# Altium schematic sheet LCD_RGB_parallel_connector.SchDoc
size A3; SheetNumber: 1; SheetTotal: 3
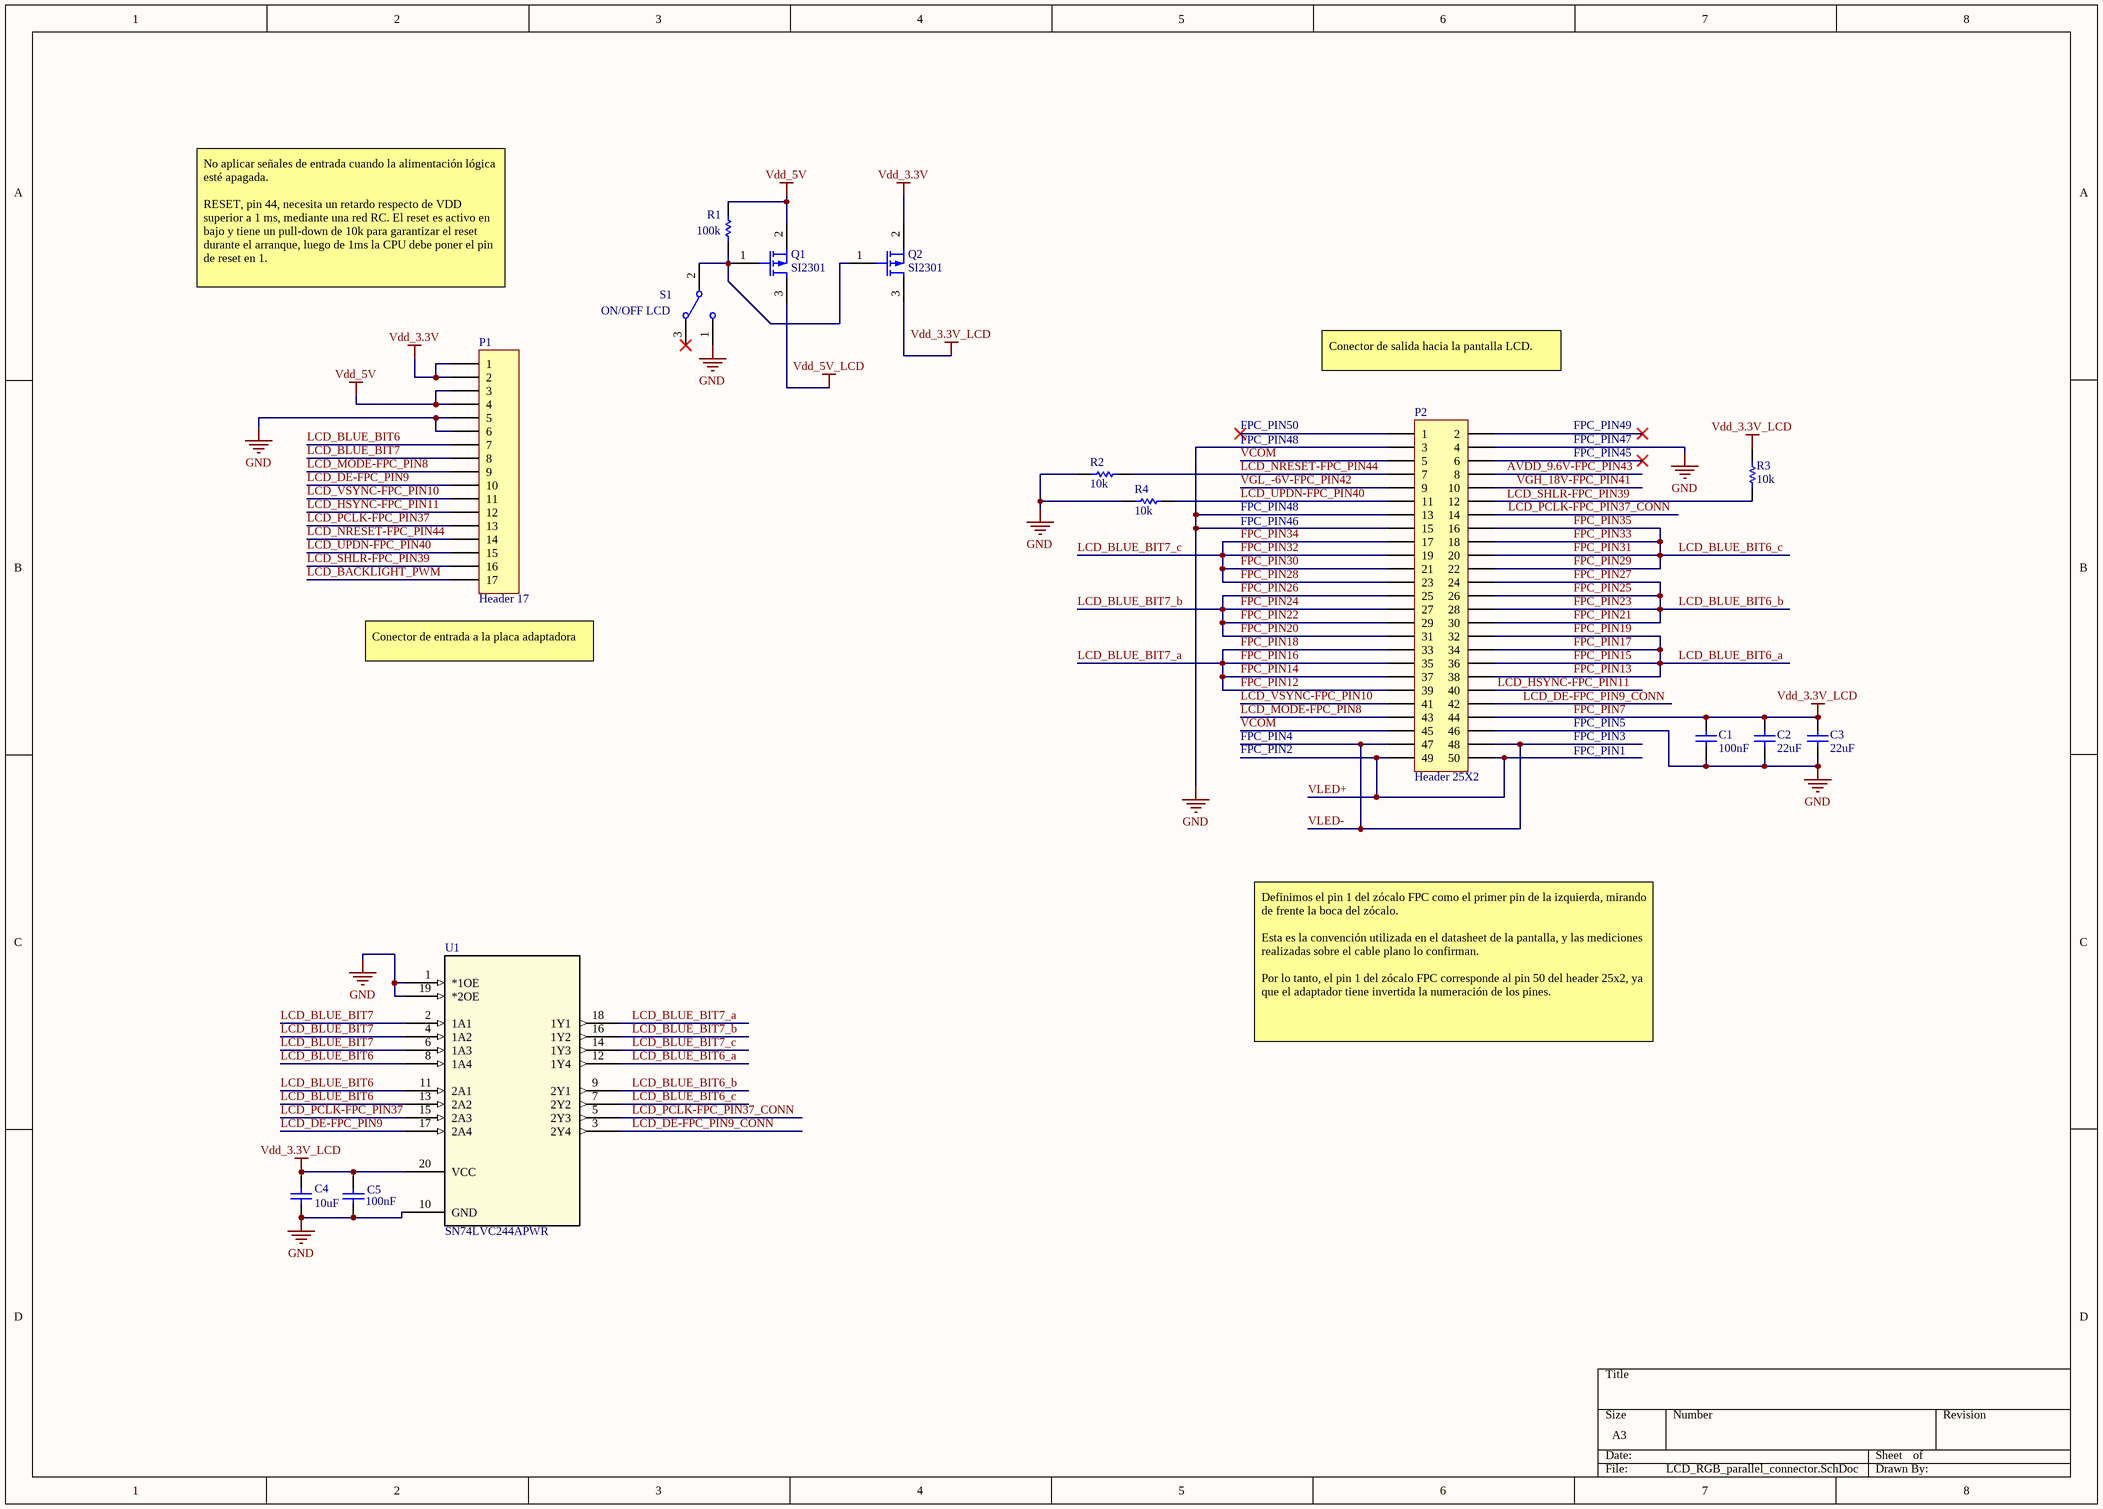
[diagram p0: LCD_RGB_parallel_connector.SchDoc]

## Parts
C1  value 100nF  [capacitor 0805]  (hidden comment: ceramic capacitor)
C2  value 22uF  [capacitor 0805]  (hidden comment: ceramic capacitor)
C3  value 22uF  [capacitor 0805]  (hidden comment: ceramic capacitor)
C4  value 10uF  [capacitor 0603]  (hidden comment: ceramic capacitor)
C5  value 100nF  [capacitor 0603]  (hidden comment: Ceramic capacitor)
P1  Header 17  [HDR1X17]
P2  Header 25X2  [HDR2X25]
Q1  SI2301  [sot-23]
Q2  SI2301  [sot-23]
R1  value 100k  [resistor 0603]  (hidden comment: Resistor)
R2  value 10k  [resistor 0603]  (hidden comment: Resistor)
R3  value 10k  [resistor 0603]  (hidden comment: Resistor)
R4  value 10k  [resistor 0603]  (hidden comment: Resistor)
S1  SW-SPDT  [Slide switch 2mm pitch]  (value not drawn)
U1  SN74LVC244APWR  [PW20]

## Nets
FPC_PIN7: C1.1 C2.2 C3.2 C4.2 C5.2 P2.44 Q2.3(D) R3.1 U1.20(VCC)  [also labelled Vdd_3.3V_LCD]
GND: C1.2 C2.1 C3.1 C4.1 C5.1 P1.5 P1.6 P2.3 P2.4 P2.13 P2.15 P2.46 R2.2 R4.1 S1.1 U1.1(*1OE) U1.10(GND) U1.19(*2OE)
Vdd_3.3V: P1.1 P1.2 Q2.2(S)
Vdd_5V: P1.3 P1.4 Q1.2(S) R1.2
Vdd_5V_LCD: Q1.3(D)
AVDD_9.6V-FPC_PIN43: P2.8
FPC_PIN12: P2.33 P2.35 P2.37 P2.39 U1.18(1Y1)  [also labelled FPC_PIN14, FPC_PIN16, FPC_PIN18, LCD_BLUE_BIT7_a]
FPC_PIN13: P2.32 P2.34 P2.36 P2.38 U1.12(1Y4)  [also labelled FPC_PIN15, FPC_PIN17, FPC_PIN19, LCD_BLUE_BIT6_a]
FPC_PIN20: P2.25 P2.27 P2.29 P2.31 U1.16(1Y2)  [also labelled FPC_PIN22, FPC_PIN24, FPC_PIN26, LCD_BLUE_BIT7_b]
FPC_PIN21: P2.24 P2.26 P2.28 P2.30 U1.9(2Y1)  [also labelled FPC_PIN23, FPC_PIN25, FPC_PIN27, LCD_BLUE_BIT6_b]
FPC_PIN28: P2.17 P2.19 P2.21 P2.23 U1.14(1Y3)  [also labelled FPC_PIN30, FPC_PIN32, FPC_PIN34, LCD_BLUE_BIT7_c]
FPC_PIN29: P2.16 P2.18 P2.20 P2.22 U1.7(2Y2)  [also labelled FPC_PIN31, FPC_PIN33, FPC_PIN35, LCD_BLUE_BIT6_c]
LCD_BACKLIGHT_PWM: P1.17
LCD_BLUE_BIT6: P1.7 U1.8(1A4) U1.11(2A1) U1.13(2A2)
LCD_BLUE_BIT7: P1.8 U1.2(1A1) U1.4(1A2) U1.6(1A3)
LCD_DE-FPC_PIN9: P1.10 U1.17(2A4)
LCD_DE-FPC_PIN9_CONN: P2.42 U1.3(2Y4)
LCD_HSYNC-FPC_PIN11: P1.12 P2.40
LCD_MODE-FPC_PIN8: P1.9 P2.43
LCD_NRESET-FPC_PIN44: P1.14 P2.7 R2.1
LCD_PCLK-FPC_PIN37: P1.13 U1.15(2A3)
LCD_PCLK-FPC_PIN37_CONN: P2.14 U1.5(2Y3)
LCD_SHLR-FPC_PIN39: P1.16 P2.12 R3.2
LCD_UPDN-FPC_PIN40: P1.15 P2.11 R4.2
LCD_VSYNC-FPC_PIN10: P1.11 P2.41
VCOM: P2.5 P2.45
VGH_18V-FPC_PIN41: P2.10
VGL_-6V-FPC_PIN42: P2.9
VLED+: P2.49 P2.50
VLED-: P2.47 P2.48
NetQ1_1: Q1.1(G) Q2.1(G) R1.1 S1.2

Not connected (* = marked no-connect by the designer): P2 1* 2* 6*; S1 3*

## Notes on the sheet
- No aplicar señales de entrada cuando la alimentación lógica esté apagada.
  RESET, pin 44, necesita un retardo respecto de VDD superior a 1 ms, mediante una red RC. El reset es activo en bajo y tiene un pull-down de 10k para garantizar el reset durante el arranque, luego de 1ms la CPU debe poner el pin de reset en 1.
- (near S1) ON/OFF LCD
- Conector de salida hacia la pantalla LCD.
- FPC_PIN50
- FPC_PIN48
- FPC_PIN47
- FPC_PIN49
- FPC_PIN45
- FPC_PIN46
- (near P1) Conector de entrada a la placa adaptadora
- FPC_PIN2
- FPC_PIN4
- FPC_PIN1
- FPC_PIN3
- FPC_PIN5
- Definimos el pin 1 del zócalo FPC como el primer pin de la izquierda, mirando de frente la boca del zócalo.
  Esta es la convención utilizada en el datasheet de la pantalla, y las mediciones realizadas sobre el cable plano lo confirman.
  Por lo tanto, el pin 1 del zócalo FPC corresponde al pin 50 del header 25x2, ya que el adaptador tiene invertida la numeración de los pines.

## Library data of the parts
C1 = ceramic capacitor: Multilayer ceramic capacitor; V: 50; LCSC part: C1711; Package: 0805
C2 C3 = ceramic capacitor: Multilayer ceramic capacitor; V: 25; LCSC part: C45783; Package: 0805
C4 = ceramic capacitor: Multilayer ceramic capacitor; V: 6.3; LCSC part: C1691; Package: 0603
C5 = Ceramic capacitor: Multilayer ceramic capacitor; V: 50; LCSC part: C14663; Package: 0603
P1 = Header 17: Header, 17-Pin; LatestRevisionDate: 17-Jul-2002; LatestRevisionNote: Re-released for DXP Platform.; Publisher: Altium Limited
P2 = Header 25X2: Header, 25-Pin, Dual row; LatestRevisionDate: 17-Jul-2002; LatestRevisionNote: Re-released for DXP Platform.; Publisher: Altium Limited
Q1 Q2 = MOSFET-P: P-Channel MOSFET; MFR part: SI2301CDS-T1-GE3; MFR: Vishay Intertech; Package: SOT-23; LCSC part: C10487
S1 = SW-SPDT: SPDT Subminiature Toggle Switch, Right Angle Mounting, Vertical Actuation; pin to pad: 1>3 3>1; Published: 24-Mar-1999; LatestRevisionDate: 17-Dec-2003; LatestRevisionNote: Schematic revised, PCB Footprint replaced.; DatasheetVersion: 05-Dec-2000; PackageReference: TL36WW15050; Publisher: Altium Limited; PackageDescription: Switch; 4 Leads; ComponentLink1Description: Manufacturer Link; ComponentLink1URL: http://www.apem.com
U1 = SN74LVC244APWR: 8-ch, 1.65-V to 3.6-V buffers with 3-state outputs 20-TSSOP -40 to 125; Manufacturer_Name: Texas Instruments; Copyright: Copyright (C) 2026 Ultra Librarian. All rights reserved.; Manufacturer_Part_Number: SN74LVC244APWR; Datasheet: https://www.ti.com/lit/gpn/sn74lvc244a; RefDes: RefDes; Type: Type
R1-R4 = Resistor: Package: 0603